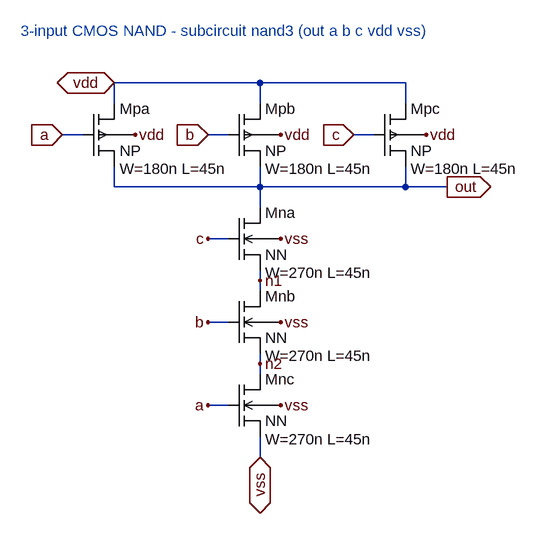
[diagram p0: schematic nand3.asc]
nand3.asc, the LTspice schematic file:
Version 4
SHEET 1 1100 840
TEXT 64 -16 Left 2 ;3-input CMOS NAND - subcircuit nand3 (out a b c vdd vss)
SYMBOL mp 160 96 R0
SYMATTR InstName Mpa
SYMATTR Value NP
SYMATTR SpiceLine W=180n L=45n
WIRE 208 96 208 64
FLAG 240 144 vdd
WIRE 160 144 128 144
FLAG 128 144 a
IOPIN 128 144 In
WIRE 208 192 208 224
SYMBOL mp 384 96 R0
SYMATTR InstName Mpb
SYMATTR Value NP
SYMATTR SpiceLine W=180n L=45n
WIRE 432 96 432 64
FLAG 464 144 vdd
WIRE 384 144 352 144
FLAG 352 144 b
IOPIN 352 144 In
WIRE 432 192 432 224
SYMBOL mp 608 96 R0
SYMATTR InstName Mpc
SYMATTR Value NP
SYMATTR SpiceLine W=180n L=45n
WIRE 656 96 656 64
FLAG 688 144 vdd
WIRE 608 144 576 144
FLAG 576 144 c
IOPIN 576 144 In
WIRE 656 192 656 224
WIRE 208 64 432 64
WIRE 432 64 656 64
FLAG 208 64 vdd
IOPIN 208 64 BiDir
WIRE 208 224 432 224
WIRE 432 224 656 224
WIRE 656 224 720 224
FLAG 720 224 out
IOPIN 720 224 Out
WIRE 432 224 432 256
SYMBOL mn 384 256 R0
SYMATTR InstName Mna
SYMATTR Value NN
SYMATTR SpiceLine W=270n L=45n
FLAG 464 304 vss
WIRE 384 304 352 304
FLAG 352 304 c
SYMBOL mn 384 384 R0
SYMATTR InstName Mnb
SYMATTR Value NN
SYMATTR SpiceLine W=270n L=45n
FLAG 464 432 vss
WIRE 384 432 352 432
FLAG 352 432 b
SYMBOL mn 384 512 R0
SYMATTR InstName Mnc
SYMATTR Value NN
SYMATTR SpiceLine W=270n L=45n
FLAG 464 560 vss
WIRE 384 560 352 560
FLAG 352 560 a
WIRE 432 352 432 368
WIRE 432 368 432 384
FLAG 432 368 n1
WIRE 432 480 432 496
WIRE 432 496 432 512
FLAG 432 496 n2
WIRE 432 608 432 640
FLAG 432 640 vss
IOPIN 432 640 BiDir

The netlist it stands for:
* nand3.asc
Mpa out a vdd vdd NP W=180n L=45n
Mpb out b vdd vdd NP W=180n L=45n
Mpc out c vdd vdd NP W=180n L=45n
Mna out c n1 vss NN W=270n L=45n
Mnb n1 b n2 vss NN W=270n L=45n
Mnc n2 a vss vss NN W=270n L=45n
.model NMOS NMOS
.model PMOS PMOS
.lib standard.mos
* 3-input CMOS NAND - subcircuit nand3 (out a b c vdd vss)
.backanno
.end